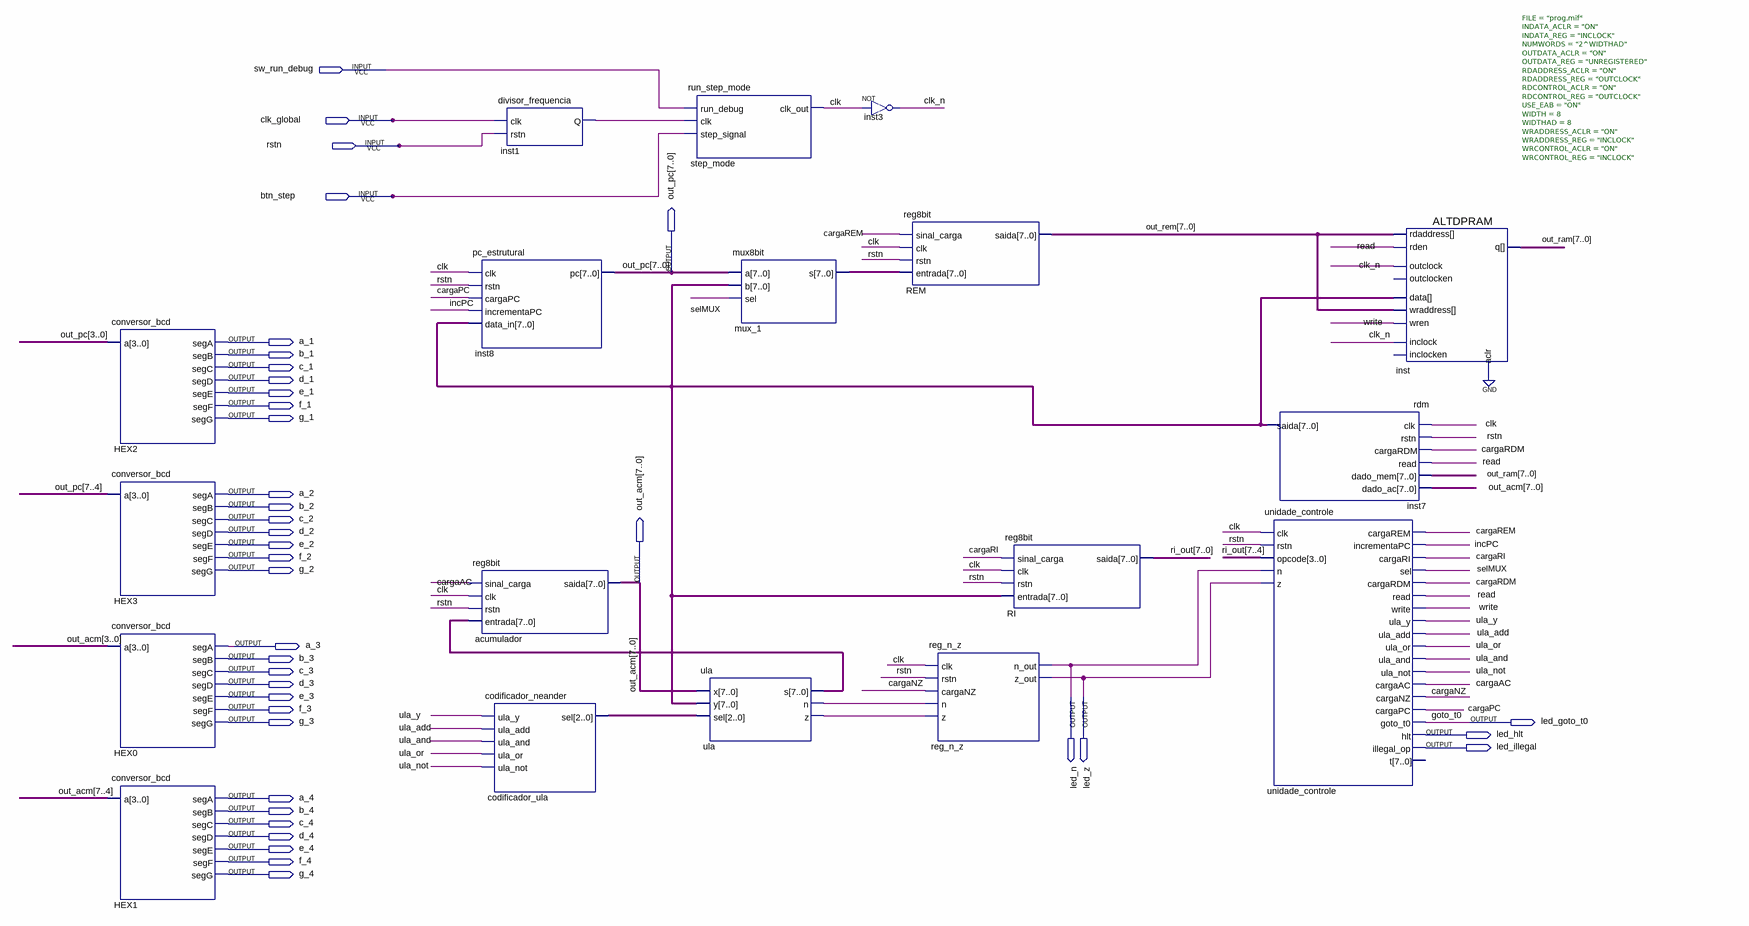
[diagram p0: schematic sheet]
// Quartus schematic neander_top.bdf as structural Verilog: 18 symbols, 39 pins
module neander_top (
  input  sw_run_debug,
  input  clk_global,
  input  rstn,
  input  btn_step,
  output [7:0] out_pc,
  output a_1,
  output b_1,
  output c_1,
  output d_1,
  output e_1,
  output f_1,
  output g_1,
  output a_2,
  output b_2,
  output c_2,
  output d_2,
  output e_2,
  output f_2,
  output g_2,
  output [7:0] out_acm,
  output a_3,
  output b_3,
  output c_3,
  output d_3,
  output e_3,
  output led_n,
  output led_z,
  output f_3,
  output g_3,
  output led_goto_t0,
  output led_hlt,
  output led_illegal,
  output a_4,
  output b_4,
  output c_4,
  output d_4,
  output e_4,
  output f_4,
  output g_4
);

  wire cargaAC, cargaNZ, cargaPC, cargaRDM, cargaREM, cargaRI, clk, clk_n, incPC, inst1_q, read, selMUX,
       ula_add, ula_and, ula_n, ula_not, ula_or, ula_y, ula_z, write;
  wire [2:0] codificador_ula_sel;
  wire [7:0] inst7_saida, mux_1_s, out_ram, out_rem, ri_out, ula_s;

  conversor_bcd HEX2 (
    .a(out_pc[3:0]), .segA(a_1), .segB(b_1), .segC(c_1), .segD(d_1), .segE(e_1), .segF(f_1), .segG(g_1));
  conversor_bcd HEX3 (
    .a(out_pc[7:4]), .segA(a_2), .segB(b_2), .segC(c_2), .segD(d_2), .segE(e_2), .segF(f_2), .segG(g_2));
  conversor_bcd HEX0 (
    .a(out_acm[3:0]), .segA(a_3), .segB(b_3), .segC(c_3), .segD(d_3), .segE(e_3), .segF(f_3), .segG(g_3));
  conversor_bcd HEX1 (
    .a(out_acm[7:4]), .segA(a_4), .segB(b_4), .segC(c_4), .segD(d_4), .segE(e_4), .segF(f_4), .segG(g_4));
  pc_estrutural inst8 (
    .clk(clk), .rstn(rstn), .cargaPC(cargaPC), .incrementaPC(incPC), .data_in(inst7_saida), .pc(out_pc));
  reg8bit acumulador (.sinal_carga(cargaAC), .clk(clk), .rstn(rstn), .entrada(ula_s), .saida(out_acm));
  codificador_neander codificador_ula (
    .ula_y(ula_y), .ula_add(ula_add), .ula_and(ula_and), .ula_or(ula_or), .ula_not(ula_not),
    .sel(codificador_ula_sel));
  divisor_frequencia inst1 (.clk(clk_global), .rstn(rstn), .Q(inst1_q));
  run_step_mode step_mode (.run_debug(sw_run_debug), .clk(inst1_q), .step_signal(btn_step), .clk_out(clk));
  mux8bit mux_1 (.a(out_pc), .b(inst7_saida), .sel(selMUX), .s(mux_1_s));
  ula ula (.x(out_acm), .y(inst7_saida), .sel(codificador_ula_sel), .s(ula_s), .n(ula_n), .z(ula_z));
  not inst3 (clk_n, clk);
  reg8bit REM (.sinal_carga(cargaREM), .clk(clk), .rstn(rstn), .entrada(mux_1_s), .saida(out_rem));
  reg_n_z reg_n_z (.clk(clk), .rstn(rstn), .cargaNZ(cargaNZ), .n(ula_n), .z(ula_z), .n_out(led_n), .z_out(led_z));
  reg8bit RI (.sinal_carga(cargaRI), .clk(clk), .rstn(rstn), .entrada(inst7_saida), .saida(ri_out));
  rdm inst7 (
    .clk(clk), .rstn(rstn), .cargaRDM(cargaRDM), .read(read), .dado_mem(out_ram), .dado_ac(out_acm),
    .saida(inst7_saida));
  unidade_controle unidade_controle (
    .clk(clk), .rstn(rstn), .opcode(ri_out[7:4]), .n(led_n), .z(led_z), .cargaREM(cargaREM),
    .incrementaPC(incPC), .cargaRI(cargaRI), .sel(selMUX), .cargaRDM(cargaRDM), .read(read), .write(write),
    .ula_y(ula_y), .ula_add(ula_add), .ula_or(ula_or), .ula_and(ula_and), .ula_not(ula_not),
    .cargaAC(cargaAC), .cargaNZ(cargaNZ), .cargaPC(cargaPC), .goto_t0(led_goto_t0), .hlt(led_hlt),
    .illegal_op(led_illegal));  // open: t
  ALTDPRAM #(.FILE("prog.mif"), .INDATA_ACLR("ON"), .INDATA_REG("INCLOCK"), .NUMWORDS("2^WIDTHAD"), .OUTDATA_ACLR("ON"), .OUTDATA_REG("UNREGISTERED"), .RDADDRESS_ACLR("ON"), .RDADDRESS_REG("OUTCLOCK"), .RDCONTROL_ACLR("ON"), .RDCONTROL_REG("OUTCLOCK"), .USE_EAB("ON"), .WIDTH(8), .WIDTHAD(8), .WRADDRESS_ACLR("ON"), .WRADDRESS_REG("INCLOCK"), .WRCONTROL_ACLR("ON"), .WRCONTROL_REG("INCLOCK")) inst (
    .inclock(clk_n), .rdaddress(out_rem), .rden(read), .wraddress(out_rem), .data(inst7_saida),
    .outclock(clk_n), .wren(write), .aclr(1'b0), .q(out_ram));  // open: inclocken, outclocken

  // Other names for the same wires on the sheet: goto_t0 = led_goto_t0
endmodule
